# Altium schematic sheet H-bridge.SchDoc: =DT_SCH_Title
size A4; Organization: Droid Technologies; SheetNumber: 10; SheetTotal: 20
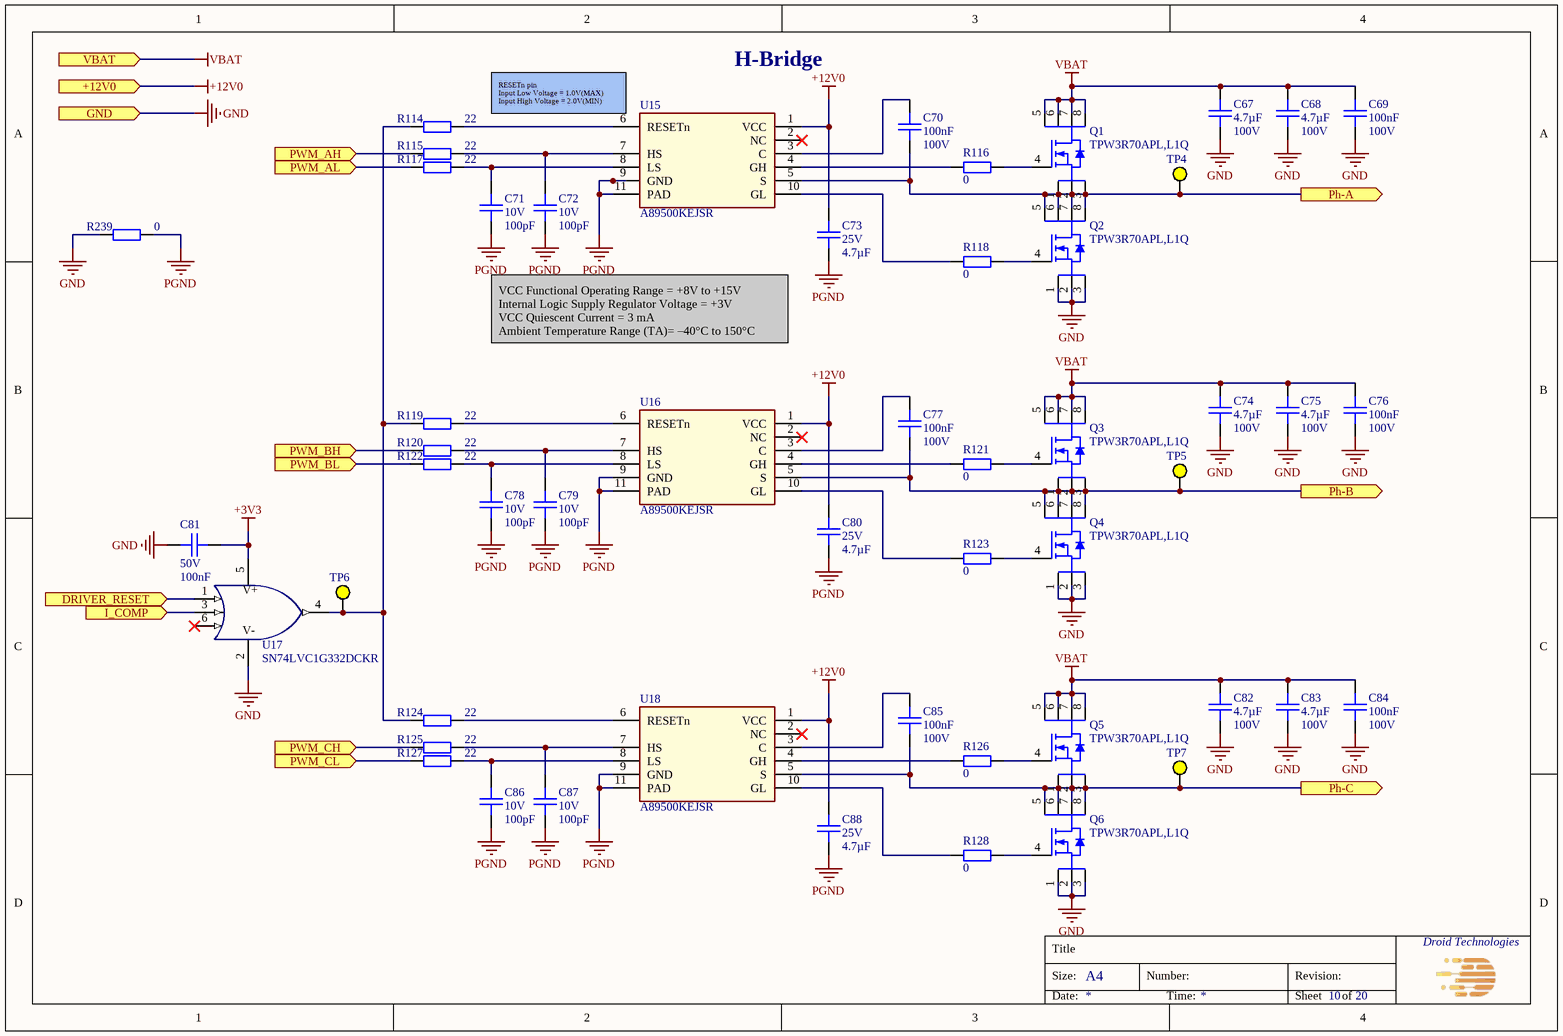
[diagram p0: H-bridge.SchDoc]

## Parts
C67  Capacitance: 4.7µF  Voltage Rating: 100V  [CAPC320X250X250L60]  (hidden comment: CL32E475KCIVPJE)
C68  Capacitance: 4.7µF  Voltage Rating: 100V  [CAPC320X250X250L60]  (hidden comment: CL32E475KCIVPJE)
C69  Capacitance: 100nF  Voltage Rating: 100V  [CAPC160X80X90L35]  (hidden comment: GCJ188L8EL104KA07D)
C70  Capacitance: 100nF  Voltage Rating: 100V  [CAPC160X80X90L35]  (hidden comment: GCJ188L8EL104KA07D)
C71  Voltage Rating: 10V  Capacitance: 100pF  [CAPC160X80X90L35]  (hidden comment: C0603C101K8HACAUTO)
C72  Voltage Rating: 10V  Capacitance: 100pF  [CAPC160X80X90L35]  (hidden comment: C0603C101K8HACAUTO)
C73  Voltage Rating: 25V  Capacitance: 4.7µF  [CAPC200X125X145L50]  (hidden comment: CGA4J1X8L1E475K125AC)
C74  Capacitance: 4.7µF  Voltage Rating: 100V  [CAPC320X250X250L60]  (hidden comment: CL32E475KCIVPJE)
C75  Capacitance: 4.7µF  Voltage Rating: 100V  [CAPC320X250X250L60]  (hidden comment: CL32E475KCIVPJE)
C76  Capacitance: 100nF  Voltage Rating: 100V  [CAPC160X80X90L35]  (hidden comment: GCJ188L8EL104KA07D)
C77  Capacitance: 100nF  Voltage Rating: 100V  [CAPC160X80X90L35]  (hidden comment: GCJ188L8EL104KA07D)
C78  Voltage Rating: 10V  Capacitance: 100pF  [CAPC160X80X90L35]  (hidden comment: C0603C101K8HACAUTO)
C79  Voltage Rating: 10V  Capacitance: 100pF  [CAPC160X80X90L35]  (hidden comment: C0603C101K8HACAUTO)
C80  Voltage Rating: 25V  Capacitance: 4.7µF  [CAPC200X125X145L50]  (hidden comment: CGA4J1X8L1E475K125AC)
C81  Voltage Rating: 50V  Capacitance: 100nF  [CAPC100x50x50L25]  (hidden comment: GCM155L8EH104KE07D)
C82  Capacitance: 4.7µF  Voltage Rating: 100V  [CAPC320X250X250L60]  (hidden comment: CL32E475KCIVPJE)
C83  Capacitance: 4.7µF  Voltage Rating: 100V  [CAPC320X250X250L60]  (hidden comment: CL32E475KCIVPJE)
C84  Capacitance: 100nF  Voltage Rating: 100V  [CAPC160X80X90L35]  (hidden comment: GCJ188L8EL104KA07D)
C85  Capacitance: 100nF  Voltage Rating: 100V  [CAPC160X80X90L35]  (hidden comment: GCJ188L8EL104KA07D)
C86  Voltage Rating: 10V  Capacitance: 100pF  [CAPC160X80X90L35]  (hidden comment: C0603C101K8HACAUTO)
C87  Voltage Rating: 10V  Capacitance: 100pF  [CAPC160X80X90L35]  (hidden comment: C0603C101K8HACAUTO)
C88  Voltage Rating: 25V  Capacitance: 4.7µF  [CAPC200X125X145L50]  (hidden comment: CGA4J1X8L1E475K125AC)
Q1  TPW3R70APL,L1Q  [TOSHIBA_2-5Q1A]
Q2  TPW3R70APL,L1Q  [TOSHIBA_2-5Q1A]
Q3  TPW3R70APL,L1Q  [TOSHIBA_2-5Q1A]
Q4  TPW3R70APL,L1Q  [TOSHIBA_2-5Q1A]
Q5  TPW3R70APL,L1Q  [TOSHIBA_2-5Q1A]
Q6  TPW3R70APL,L1Q  [TOSHIBA_2-5Q1A]
R114  Resistance: 22  [RESC100X50X40L25]  (hidden comment: RC0402FR-0722RL)
R115  Resistance: 22  [RESC100X50X40L25]  (hidden comment: RC0402FR-0722RL)
R116  Resistance: 0  [RESC160X80X55L30]  (hidden comment: RC0603FR-070RL)
R117  Resistance: 22  [RESC100X50X40L25]  (hidden comment: RC0402FR-0722RL)
R118  Resistance: 0  [RESC160X80X55L30]  (hidden comment: RC0603FR-070RL)
R119  Resistance: 22  [RESC100X50X40L25]  (hidden comment: RC0402FR-0722RL)
R120  Resistance: 22  [RESC100X50X40L25]  (hidden comment: RC0402FR-0722RL)
R121  Resistance: 0  [RESC160X80X55L30]  (hidden comment: RC0603FR-070RL)
R122  Resistance: 22  [RESC100X50X40L25]  (hidden comment: RC0402FR-0722RL)
R123  Resistance: 0  [RESC160X80X55L30]  (hidden comment: RC0603FR-070RL)
R124  Resistance: 22  [RESC100X50X40L25]  (hidden comment: RC0402FR-0722RL)
R125  Resistance: 22  [RESC100X50X40L25]  (hidden comment: RC0402FR-0722RL)
R126  Resistance: 0  [RESC160X80X55L30]  (hidden comment: RC0603FR-070RL)
R127  Resistance: 22  [RESC100X50X40L25]  (hidden comment: RC0402FR-0722RL)
R128  Resistance: 0  [RESC160X80X55L30]  (hidden comment: RC0603FR-070RL)
R239  Resistance: 0  [RESC160X80X55L30]  (hidden comment: RC0603FR-070RL)
TP4  Test Point  [TP_D0.75mm]  (value not drawn)
TP5  Test Point  [TP_D0.75mm]  (value not drawn)
TP6  Test Point  [TP_D0.75mm]  (value not drawn)
TP7  Test Point  [TP_D0.75mm]  (value not drawn)
U15  A89500KEJSR  [A89500KEJSR]
U16  A89500KEJSR  [A89500KEJSR]
U17  SN74LVC1G332DCKR  [SC70-6]
U18  A89500KEJSR  [A89500KEJSR]

## Ports
+12V0 (in), DRIVER_RESET (in), GND (in), I_COMP (in), Ph-A (out), Ph-B (out), Ph-C (out), PWM_AH (in), PWM_AL (in), PWM_BH (in), PWM_BL (in), PWM_CH (in), PWM_CL (in), VBAT (in)

## Nets
+3V3: C81.2 U17.5(VCC)
+12V0: C73.2 C80.2 C88.2 U15.1(VCC) U16.1(VCC) U18.1(VCC) ; port +12V0
GND: C67.1 C68.1 C69.1 C74.1 C75.1 C76.1 C81.1 C82.1 C83.1 C84.1 Q2.1 Q2.2 Q2.3 Q4.1 Q4.2 Q4.3 Q6.1 Q6.2 Q6.3 R239.2 U17.2(GND) ; port GND
PGND: C71.1 C72.1 C73.1 C78.1 C79.1 C80.1 C86.1 C87.1 C88.1 R239.1 U15.9(GND) U15.11(PAD) U16.9(GND) U16.11(PAD) U18.9(GND) U18.11(PAD)
VBAT: C67.2 C68.2 C69.2 C74.2 C75.2 C76.2 C82.2 C83.2 C84.2 Q1.5 Q1.6 Q1.7 Q1.8 Q3.5 Q3.6 Q3.7 Q3.8 Q5.5 Q5.6 Q5.7 Q5.8 ; port VBAT
DRIVER_RESET: U17.1(A) ; port DRIVER_RESET
I_COMP: U17.3(B) ; port I_COMP
Ph-A: C70.1 Q1.1 Q1.2 Q1.3 Q2.5 Q2.6 Q2.7 Q2.8 TP4.1 U15.5(S) ; port Ph-A
Ph-B: C77.1 Q3.1 Q3.2 Q3.3 Q4.5 Q4.6 Q4.7 Q4.8 TP5.1 U16.5(S) ; port Ph-B
Ph-C: C85.1 Q5.1 Q5.2 Q5.3 Q6.5 Q6.6 Q6.7 Q6.8 TP7.1 U18.5(S) ; port Ph-C
PWM_AH: R115.1 ; port PWM_AH
PWM_AL: R117.1 ; port PWM_AL
PWM_BH: R120.1 ; port PWM_BH
PWM_BL: R122.1 ; port PWM_BL
PWM_CH: R125.1 ; port PWM_CH
PWM_CL: R127.1 ; port PWM_CL
NetC70_2: C70.2 U15.3(C)
NetC71_2: C71.2 R117.2 U15.8(LS)
NetC72_2: C72.2 R115.2 U15.7(HS)
NetC77_2: C77.2 U16.3(C)
NetC78_2: C78.2 R122.2 U16.8(LS)
NetC79_2: C79.2 R120.2 U16.7(HS)
NetC85_2: C85.2 U18.3(C)
NetC86_2: C86.2 R127.2 U18.8(LS)
NetC87_2: C87.2 R125.2 U18.7(HS)
NetQ1_4: Q1.4 R116.2
NetQ2_4: Q2.4 R118.2
NetQ3_4: Q3.4 R121.2
NetQ4_4: Q4.4 R123.2
NetQ5_4: Q5.4 R126.2
NetQ6_4: Q6.4 R128.2
NetR114_1: R114.1 R119.1 R124.1 TP6.1 U17.4(Y)
NetR114_2: R114.2 U15.6(RESETn)
NetR116_1: R116.1 U15.4(GH)
NetR118_1: R118.1 U15.10(GL)
NetR119_2: R119.2 U16.6(RESETn)
NetR121_1: R121.1 U16.4(GH)
NetR123_1: R123.1 U16.10(GL)
NetR124_2: R124.2 U18.6(RESETn)
NetR126_1: R126.1 U18.4(GH)
NetR128_1: R128.1 U18.10(GL)

Not connected (* = marked no-connect by the designer): U15 2(NC)*; U16 2(NC)*; U17 6(C)*; U18 2(NC)*

## Notes on the sheet
- (near U15) RESETn pin
  Input Low Voltage = 1.0V(MAX)
  Input High Voltage = 2.0V(MIN)
- H-Bridge
- VCC Functional Operating Range = +8V to +15V
  Internal Logic Supply Regulator Voltage = +3V
  VCC Quiescent Current = 3 mA
  Ambient Temperature Range (TA)= –40°C to 150°C
- Title
- Size:
- A4
- Number:
- Revision:
- Date:
- Time:
- Sheet
- of
- (in symbol SN74LVC1G332DCKR) V+; V-

## Library data of the parts
C67 C68 C74 C75 C82 C83 = CMP-001-2005-2: CAP CER 4.7UF 100V X8L 1210; Manufacturer: Samsung Electro-Mechanics; Op Temp min: -55°C; Tolerance: 10%; Op Temp max: 150°C; Lead Spacing: 0mm; ComponentLink3Description: Digikey; ComponentLink1Description: Datasheet; ComponentLink3URL: https://www.digikey.com/en/products/detail/samsung-electro-mechanics/CL32E475KCIVPJE/20498500; Ratings: AEC-Q200; ComponentLink2URL: https://eu.mouser.com/ProductDetail/Samsung-Electro-Mechanics/CL32E475KCIVPJE?qs=Imq1NPwxi77B1%252BqSJu7fiA%3D%3D; ComponentLink1URL: https://product.samsungsem.com/mlcc/CL32E475KCIVPJ.do; MPN: CL32E475KCIVPJE; Mounting Type: SM; Size: 3.20mm x 2.50mm; Dielectric: X8L; ComponentLink2Description: Mouser; Package: 1210 (3225 Metric); Height max: 2.3mm
C69 C70 C76 C77 C84 C85 = CMP-001-2003-2: CAP CER 0.1UF 100V X8L 0603; Manufacturer: Murata Electronics; Tolerance: 10%; Op Temp min: -55°C; Op Temp max: 150°C; Package: 0603 (1608 Metric); ComponentLink3URL: https://www.digikey.com/en/products/detail/murata-electronics/GCJ188L8EL104KA07D/11618648; Lead Spacing: 0mm; ComponentLink1Description: Datasheet; ComponentLink1URL: https://www.murata.com/en-us/products/productdetail?partno=GCJ188L8EL104KA07%23; ComponentLink3Description: Digikey; MPN: GCJ188L8EL104KA07D; Ratings: AEC-Q200; ComponentLink2Description: Mouser; Height max: 900µm; Dielectric: X8L; Mounting Type: SM; ComponentLink2URL: https://eu.mouser.com/ProductDetail/Murata-Electronics/GCJ188L8EL104KA07D?qs=rrS6PyfT74fTpbPMbkPm2A%3D%3D; Size: 1.60mm x 0.80mm
C71 C72 C78 C79 C86 C87 = CMP-001-2002-2: CAP CER 0603 100PF 10V ULTRA STA; Manufacturer: KEMET; Dielectric: X8R; Op Temp max: 150°C; Op Temp min: -55°C; Tolerance: 10%; ComponentLink2Description: Mouser; Height max: 870µm; ComponentLink3Description: Digikey; ComponentLink3URL: https://www.digikey.com/en/products/detail/kemet/C0603C101K8HACAUTO/7957168; ComponentLink2URL: https://eu.mouser.com/ProductDetail/KEMET/C0603C101K8HACAUTO?qs=j%252B1pi9TdxUaad%2FlKIn1CPA%3D%3D; Lead Spacing: 0mm; Package: 0603 (1608 Metric); MPN: C0603C101K8HACAUTO; Mounting Type: SM; ComponentLink1URL: https://www.kemet.com/en/us/product/C0603C101K8HACAUTO.html; Ratings: AEC-Q200; Size: 1.60mm x 0.80mm; ComponentLink1Description: Datasheet
C73 C80 C88 = CMP-001-2004-3: CAP CER 4.7UF 25V X8L 0805; Manufacturer: TDK Corporation; Op Temp max: 150°C; Op Temp min: -55°C; Tolerance: 10%; ComponentLink1URL: https://product.tdk.com/en/search/capacitor/ceramic/mlcc/info?part_no=CGA4J1X8L1E475K125AC; Package: 0805 (2012 Metric); Size: 2.00mm x 1.25mm; Height max: 1.5mm; Lead Spacing: 0mm; Ratings: AEC-Q200; ComponentLink1Description: Datasheet; ComponentLink3Description: Digikey; MPN: CGA4J1X8L1E475K125AC; Mounting Type: SM; ComponentLink2URL: https://eu.mouser.com/ProductDetail/TDK/CGA4J1X8L1E475K125AC?qs=gZXFycFWdANxpKJOMQuJTA%3D%3D; ComponentLink3URL: https://www.digikey.com/en/products/detail/tdk-corporation/CGA4J1X8L1E475K125AC/9991390; ComponentLink2Description: Mouser; Dielectric: X8L
C81 = CMP-001-1980-2: CAP CER 0.1UF 50V X8L 0402; Manufacturer: Murata Electronics; Op Temp max: 150°C; Op Temp min: -55°C; Tolerance: 10%; Height max: 550µm; ComponentLink3Description: Digikey; Mounting Type: SM; ComponentLink3URL: https://www.digikey.com/en/products/detail/murata-electronics/GCM155L8EH104KE07D/11618823; Package: 0402 (1005 Metric); Lead Spacing: 0mm; MPN: GCM155L8EH104KE07D; Size: 1.00mm x 0.50mm; Ratings: AEC-Q200; ComponentLink1URL: https://www.murata.com/en-us/products/productdetail?partno=GCM155L8EH104KE07%23; ComponentLink1Description: Datasheet; Dielectric: X8L; ComponentLink2Description: Mouser; ComponentLink2URL: https://eu.mouser.com/ProductDetail/Murata-Electronics/GCM155L8EH104KE07D?qs=1mbolxNpo8fQSHf0HYnZWw%3D%3D
Q1-Q6 = TPW3R70APL,L1Q: PB-F POWER MOSFET TRANSISTOR DSO; Manufacturer: Toshiba Semiconductor and Storage; MPN: TPW3R70APL,L1Q
R114 R115 R117 R119 R120 R122 R124 R125 R127 = CMP-001-0482-4: RES 22 OHM 1% 1/16W 0402; Manufacturer: YAGEO; Temperature Coefficient: ±100ppm; Op Temp max: 155°C; Op Temp min: -55°C; Power: 63mW; Ratings: -; ComponentLink3URL: https://www.digikey.com/en/products/detail/yageo/RC0402FR-0722RL/726562; ComponentLink2URL: https://eu.mouser.com/ProductDetail/YAGEO/RC0402FR-0722RL?qs=V1yeUXFNrkkRg6zf08ADKQ%3D%3D; MPN: RC0402FR-0722RL; ComponentLink1Description: Datasheet; ComponentLink3Description: Digikey; Tolerance: 1%; Size: 1.00mm x 0.50mm; ComponentLink1URL: https://www.yageo.com/upload/media/product/productsearch/datasheet/rchip/PYu-RC_Group_51_RoHS_L_12.pdf; Composition: Thick Film; ComponentLink2Description: Mouser; Mounting Type: SM; Package: 0402 (1005 Metric); Height max: 400µm
R116 R118 R121 R123 R126 R128 R239 = CMP-001-0927-2: RES 0 OHM JUMPER 1/10W 0603; Manufacturer: YAGEO; Op Temp min: -55°C; Op Temp max: 155°C; Power: 100mW; Tolerance: 0%; Height max: 550µm; ComponentLink2URL: https://eu.mouser.com/ProductDetail/YAGEO/RC0603FR-070RL?qs=0yPvnVz5%2FmpDQv43TwvCfw%3D%3D; Temperature Coefficient: -; ComponentLink3Description: Digikey; ComponentLink2Description: Mouser; MPN: RC0603FR-070RL; ComponentLink1URL: https://www.yageo.com/upload/media/product/productsearch/datasheet/rchip/PYu-RC_Group_51_RoHS_L_12.pdf; Ratings: -; Size: 1.60mm x 0.80mm; Composition: Thick Film; Mounting Type: SM; ComponentLink3URL: https://www.digikey.com/en/products/detail/yageo/RC0603FR-070RL/1304008; Package: 0603 (1608 Metric); ComponentLink1Description: Datasheet
TP4-TP7 = TP_0.75: Test point 0.75mm
U15 U16 U18 = A89500KEJSR: IC GATE DRVR HALF-BRIDGE 10DFN; Manufacturer: Allegro MicroSystems; MPN: A89500KEJSR
U17 = SN74LVC1G332DCKR: IC GATE OR 1CH 3-INP SC70-6; Manufacturer: Texas Instruments; MPN: SN74LVC1G332DCKR